# Altium schematic sheet ADL S PCH 600 STRAP.schdoc
size 297 x 210 mm; Symbol: Sheet-Symbol_A4; Company: 嘉立创EDA; Version: V1.0; Page Size: A4; @Project Name: H610(2024/12/09); @Page Count: 36; @Update Date: 2025-10-09; @Create Date: 2025-10-09; @Schematic Name: SCHEMATIC1; @Page No: 8; @Page Name: ADL S PCH 600 STRAP; Device: Sheet-Symbol_A4_1; @Board Name: SCHEMATIC1; @Create Time: 10:15:40; @Update Time: 10:18:17
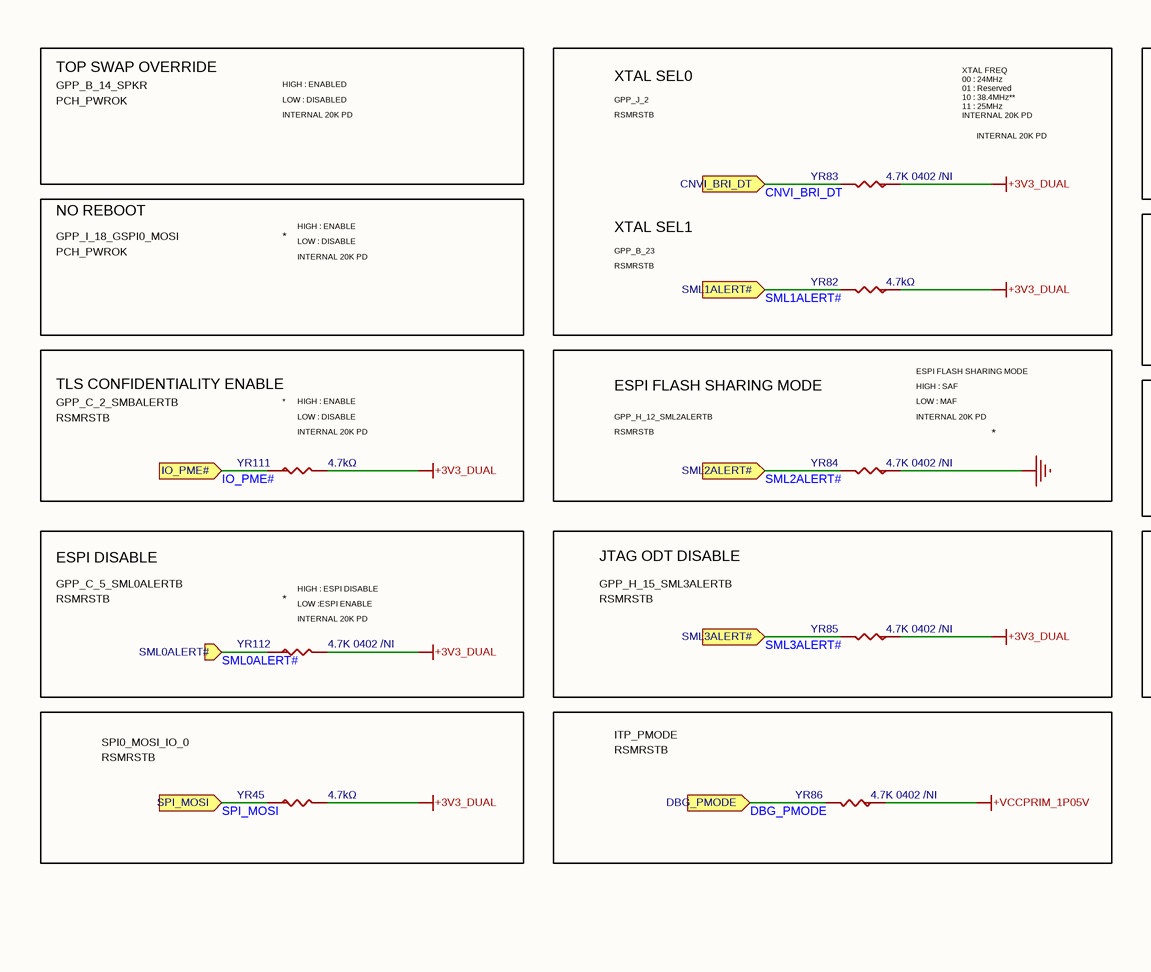
[diagram p0: ADL S PCH 600 STRAP.schdoc, top left]
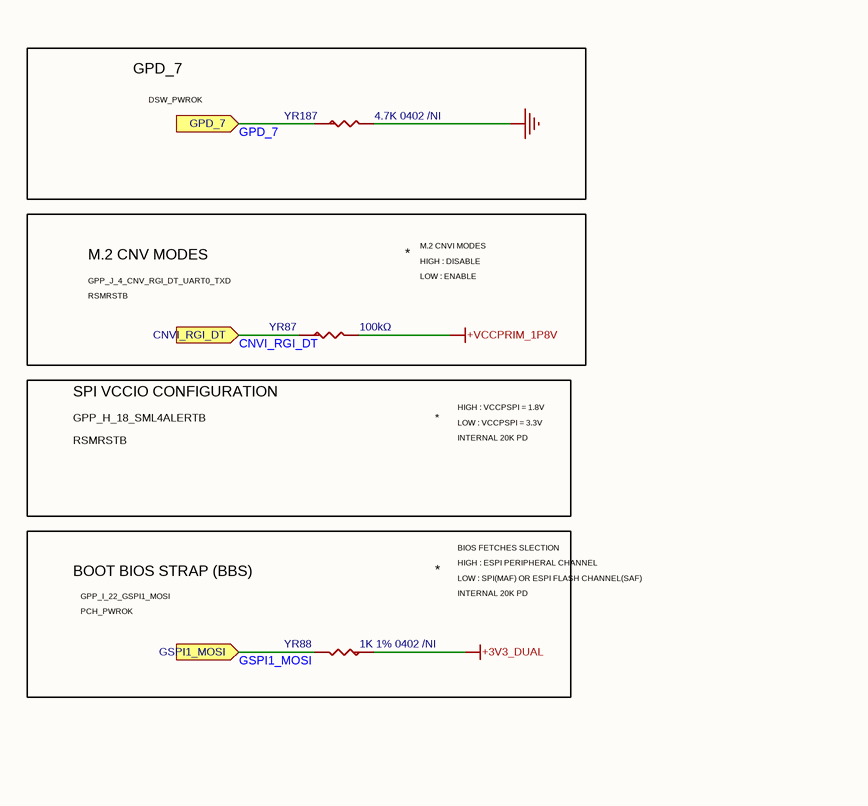
[diagram p1: ADL S PCH 600 STRAP.schdoc, top right]
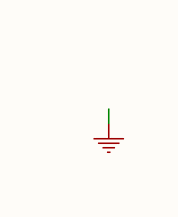
[diagram p2: ADL S PCH 600 STRAP.schdoc, bottom right]

## Parts
YR45  4.7kΩ  [R0402_3]
YR82  4.7kΩ  [R0402]
YR83  value 4.7K 0402 /NI  [R0402_3]  (hidden comment: R-0603)
YR84  value 4.7K 0402 /NI  [R0402]  (hidden comment: R-0603)
YR85  value 4.7K 0402 /NI  [R0402]  (hidden comment: R-0603)
YR86  value 4.7K 0402 /NI  [R0402_2]  (hidden comment: R-0603)
YR87  100kΩ  [R0402]
YR88  value 1K 1% 0402 /NI  [R0402_1]  (hidden comment: R-0603)
YR111  4.7kΩ  [R0402_2]
YR112  value 4.7K 0402 /NI  [R0402_2]  (hidden comment: R-0603)
YR187  value 4.7K 0402 /NI  [R0402_3]  (hidden comment: R-0603)

## Blocks framed on the sheet
GPD_7: YR187
M.2 CNV MODES: YR87
TLS CONFIDENTIALITY ENABLE: YR111
ESPI FLASH SHARING MODE: YR84
ESPI DISABLE: YR112
JTAG ODT DISABLE: YR85
BOOT BIOS STRAP (BBS): YR88

## Ports
CNVI_BRI_DT (in), CNVI_RGI_DT (in), DBG_PMODE (in), GPD_7 (in), GSPI1_MOSI (in), IO_PME# (in), SML0ALERT# (in), SML1ALERT# (in), SML2ALERT# (in), SML3ALERT# (in), SPI_MOSI (in)

## Nets
+3V3_DUAL: YR45.2 YR82.1 YR83.1 YR85.1 YR88.1 YR111.2 YR112.2
+VCCPRIM_1P05V: YR86.1
+VCCPRIM_1P8V: YR87.2
GND: YR84.1 YR187.2
CNVI_BRI_DT: YR83.2 ; port CNVI_BRI_DT
CNVI_RGI_DT: YR87.1 ; port CNVI_RGI_DT
DBG_PMODE: YR86.2 ; port DBG_PMODE
GPD_7: YR187.1 ; port GPD_7
GSPI1_MOSI: YR88.2 ; port GSPI1_MOSI
IO_PME#: YR111.1 ; port IO_PME#
SML0ALERT#: YR112.1 ; port SML0ALERT#
SML1ALERT#: YR82.2 ; port SML1ALERT#
SML2ALERT#: YR84.2 ; port SML2ALERT#
SML3ALERT#: YR85.2 ; port SML3ALERT#
SPI_MOSI: YR45.1 ; port SPI_MOSI

## Notes on the sheet
- PCH_PWROK
- TOP SWAP OVERRIDE
- GPP_B_14_SPKR
- INTERNAL 20K PD
- LOW : DISABLED
- HIGH : ENABLED
- XTAL SEL0
- GPP_J_2
- RSMRSTB
- XTAL FREQ
  00 : 24MHz
  01 : Reserved
  10 : 38.4MHz**
  11 : 25MHz
  INTERNAL 20K PD
- DSW_PWROK
- GPP_I_18_GSPI0_MOSI
- NO REBOOT
- *
- HIGH : ENABLE
- LOW : DISABLE
- XTAL SEL1
- GPP_B_23
- HIGH : DISABLE
- M.2 CNVI MODES
- GPP_J_4_CNV_RGI_DT_UART0_TXD
- LOW : ENABLE
- GPP_C_2_SMBALERTB
- (near YR111) LOW : DISABLE
- GPP_H_12_SML2ALERTB
- HIGH : SAF
- LOW : MAF
- ESPI FLASH SHARING MODE
- (near YR84) INTERNAL 20K PD
- SPI VCCIO CONFIGURATION
- GPP_H_18_SML4ALERTB
- HIGH : VCCPSPI = 1.8V
- (near YR111) INTERNAL 20K PD
- LOW : VCCPSPI = 3.3V
- BIOS FETCHES SLECTION
- HIGH : ESPI PERIPHERAL CHANNEL
- GPP_C_5_SML0ALERTB
- (near YR112) *
- (near YR112) LOW :ESPI ENABLE
- HIGH : ESPI DISABLE
- (near YR112) INTERNAL 20K PD
- GPP_H_15_SML3ALERTB
- GPP_I_22_GSPI1_MOSI
- LOW : SPI(MAF) OR ESPI FLASH CHANNEL(SAF)
- SPI0_MOSI_IO_0
- ITP_PMODE
- 更新日期
- 2025-10-09
- 原理图
- 图页
- SCHEMATIC1
- ADL S PCH 600 STRAP
- 创建日期
- 物料编码
- 审阅
- 绘制
- H610(2024/12/09)
- 版本
- V1.0
- 尺寸
- A4
- 页
- 8
- 嘉立创EDA
- 共
- 36

## Library data of the parts
YR45 YR82 YR111 = 0402WGF4701TCE: 电阻类型:厚膜电阻;阻值:4.7kΩ;精度:±1%;功率:62.5mW;; Manufacturer: UNI-ROYAL(厚声); Symbol: R-0603; ModelId: 671aefced39d4c318694bba8bd8efd39; Tolerance: ±1%; AddInBom: yes; Power(Watts): 62.5mW; ModelName: R0402_L1.0-W0.5-H0.5; ModelTransform: 39.37,19.685,0,0,0,0,0,0.0005,0; Overload Voltage (Max): 50V; Temperature Coefficient: ±100ppm/℃; Device: 0402WGF4701TCE; Value: 4.7kΩ; Type: 厚膜电阻; Supplier: LCSC; Datasheet: https://atta.szlcsc.com/upload/public/pdf/source/20200306/C422600_1E6D84923E4A46A82E41ADD87F860B5C.pdf; SupplierPart: C25900; ConvertToPcb: yes; LCSC Part Name: 4.7kΩ ±1% 62.5mW; JLCPCB Part Class: Basic Part; ManufacturerPart: 0402WGF4701TCE; Supplier Footprint: 0402; Operating Temperature Range: -55℃~+155℃
  YR45: FootprintName: R0402_3
  YR82: FootprintName: R0402
  YR111: FootprintName: R0402_2
YR83 YR187 = R-0603: Add into BOM: no; Check: false; Convert to PCB: no; Device: R-0603; Symbol: R-0603; FootprintName: R0402_3
YR84 YR85 = R-0603_1: Add into BOM: no; Check: false; Convert to PCB: no; Device: R-0603_1; Symbol: R-0603; FootprintName: R0402
YR86 YR112 = R-0603_2: Add into BOM: no; Check: false; Convert to PCB: no; Device: R-0603_2; Symbol: R-0603; FootprintName: R0402_2
YR87 = 0402WGF1003TCE: 电阻类型:厚膜电阻;阻值:100kΩ;精度:±1%;功率:62.5mW;; Manufacturer: UNI-ROYAL(厚声); Symbol: R-0603; ModelId: 671aefced39d4c318694bba8bd8efd39; Tolerance: ±1%; AddInBom: yes; Power(Watts): 62.5mW; ModelName: R0402_L1.0-W0.5-H0.5; ModelTransform: 39.37,19.685,0,0,0,0,0,0.0005,0; Overload Voltage (Max): 50V; Temperature Coefficient: ±100ppm/℃; Device: 0402WGF1003TCE; Value: 100kΩ; Type: 厚膜电阻; Supplier: LCSC; Datasheet: https://atta.szlcsc.com/upload/public/pdf/source/20200306/C422600_1E6D84923E4A46A82E41ADD87F860B5C.pdf; FootprintName: R0402; SupplierPart: C25741; ConvertToPcb: yes; LCSC Part Name: 100kΩ ±1% 62.5mW; JLCPCB Part Class: Basic Part; ManufacturerPart: 0402WGF1003TCE; Supplier Footprint: 0402; Operating Temperature Range: -55℃~+155℃
YR88 = R-0603_3: Add into BOM: no; Check: false; Convert to PCB: no; Device: R-0603_3; Symbol: R-0603; FootprintName: R0402_1